# Altium project STM32G473CBT6_PMSMCtrl.PrjPcb
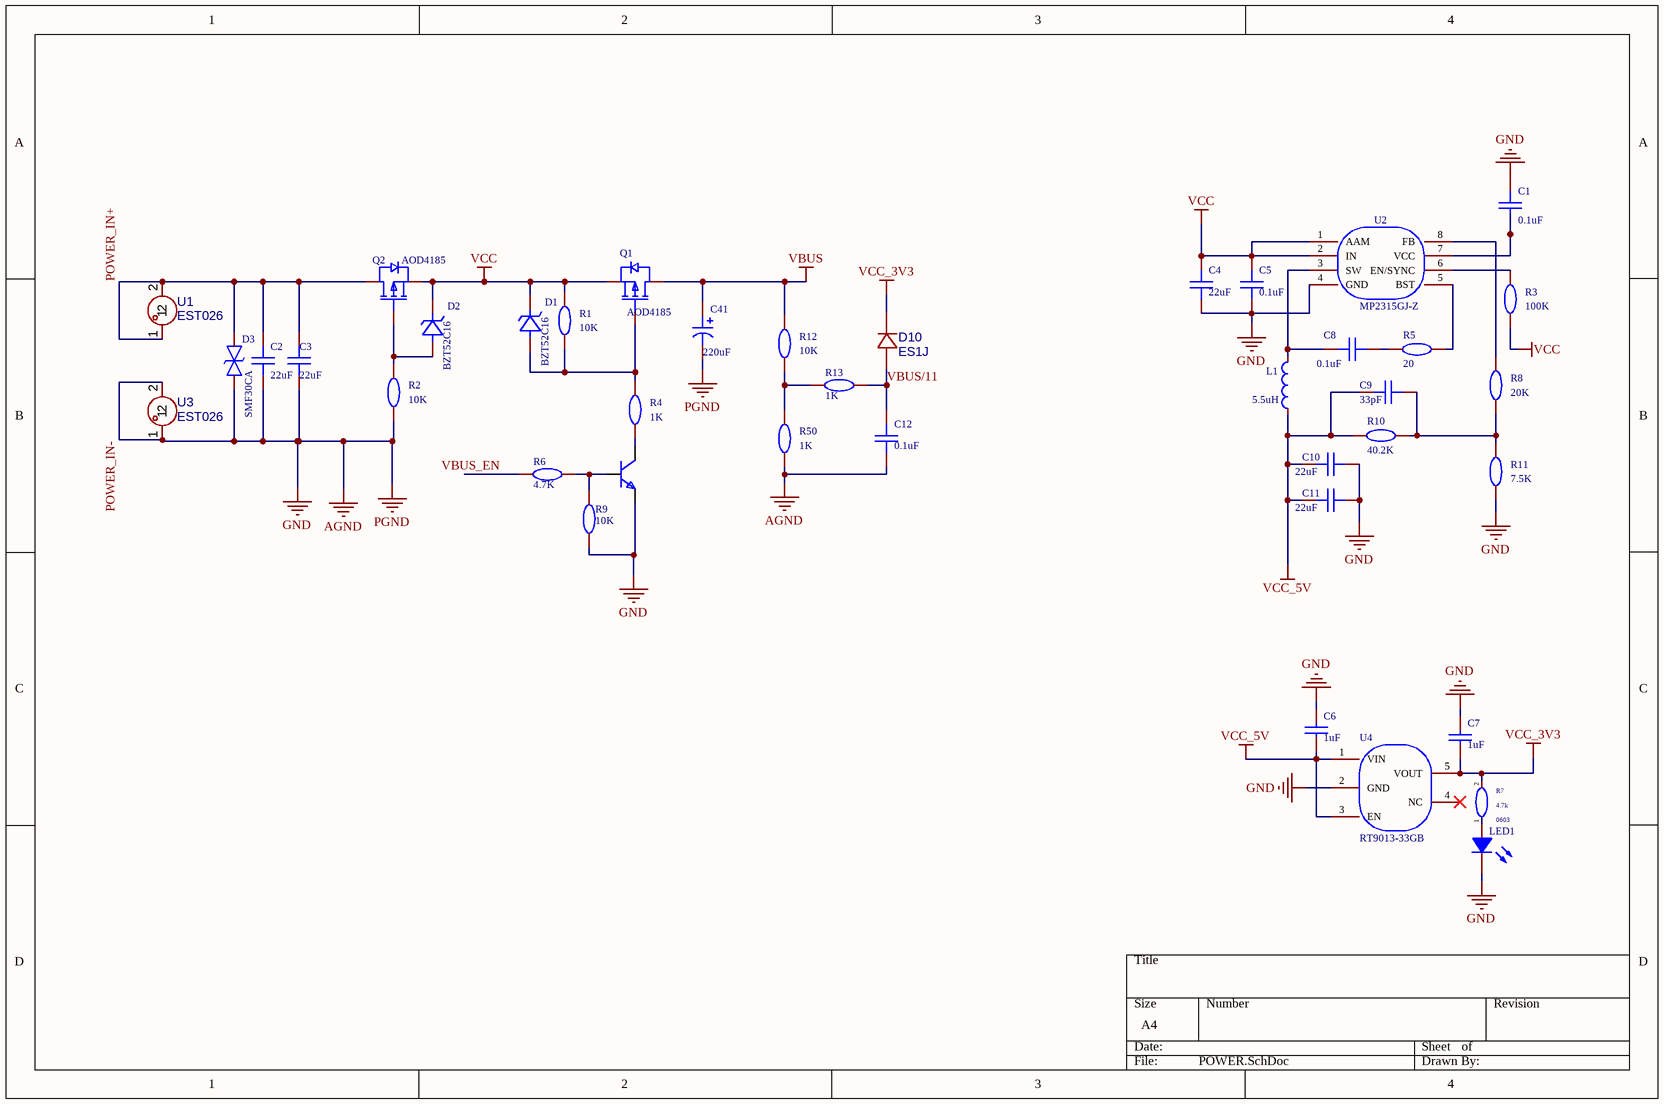
[diagram p0: POWER.SchDoc]
4 sheets, 168 parts. Net scope: global (net labels, ports and power ports of the same name join across sheets).
Board file: PCB1.PcbDoc
Sheets:
  POWER.SchDoc
  MCU.SchDoc
  PreDriver.SchDoc
  OPA.SchDoc

## Sheet POWER.SchDoc
size A4

### Parts
C1  0.1uF  [C0603]
C2  22uF  [C0603]
C3  22uF  [C0603]
C4  22uF  [C0603]
C5  0.1uF  [C0603]
C6  1uF  [C0603]
C7  1uF  [C0603]
C8  0.1uF  [C0603]
C9  33pF  [C0603]
C10  22uF  [C0805]
C11  22uF  [C0805]
C12  0.1uF  [C0603]
C41  220uF  [CAP-SMD_BD6.3-L6.6-W6.6-FD]
D1  BZT52C16  [SOD-123_L2.7-W1.6-LS3.7-RD]
D2  BZT52C16  [SOD-123_L2.7-W1.6-LS3.7-RD]
D3  SMF30CA  [SOD-123_L2.7-W1.8-LS3.7-BI]
D10  ES1J  [SMA_L4.4-W2.8-LS5.4-RD]
L1  5.5uH  [IND-SMD_L10.5-W10.2-HSB-1050]
LED1  (no value)  [LED_0603]
Q1  AOD4185  [TO-252-2_L6.6-W6.1-P4.57-LS9.9-BR-CW]
Q2  AOD4185  [TO-252-2_L6.6-W6.1-P4.57-LS9.9-BR-CW]
Q3  s8050_c20069125  [SOT-23-3_L2.9-W1.3-P1.90-LS2.3-BR]  (value not drawn)
R1  10K  [R0603]
R2  10K  [R0603]
R3  100K  [R0603]
R4  1K  [R0603]
R5  20  [R0603]
R6  4.7K  [R0603]
R7  value 4.7k  Footprint_1: 0603  [R0603]  (hidden comment: My_Library_Res-0603)
R8  20K  [R0603]
R9  10K  [R0603]
R10  40.2K  [R0603]
R11  7.5K  [R0603]
R12  10K  [R0603]
R13  1K  [R0603]
R50  1K  [R0603]
U1  EST026  [CONN-TH_L6.3-W0.8-EST026]
U2  MP2315GJ-Z  [TSOT-23-8_L2.9-W1.6-P0.65-LS2.8-BR]
U3  EST026  [CONN-TH_L6.3-W0.8-EST026]
U4  RT9013-33GB  [SOT-23-5_L3.0-W1.7-P0.95-LS2.8-BL]

### Nets
AGND: C1.1 C2.1 C3.1 C4.1 C5.1 C6.2 C7.2 C10.2 C11.2 C12.1 C41.2 D3.1 LED1.1(C) Q3.2(E) R2.1 R9.2 R11.1 R50.1 U2.4(GND) U3.1 U3.2 U4.2(GND)  [also labelled GND, PGND, POWER_IN-]
VBUS: C41.1 Q1.2(D) R12.2
VCC: C4.2 C5.2 D1.1(K) D2.1(K) Q1.3(S) Q2.3(S) R1.2 R3.2 U2.1(AAM) U2.2(IN)
VCC_3V3: C7.1 D10.1(C) R7.2 U4.5(VOUT)
VCC_5V: C6.1 C9.1 C10.1 C11.1 L1.1 R10.2 U4.1(VIN) U4.3(EN)
POWER_IN+: C2.2 C3.2 D3.2 Q2.2(D) U1.1 U1.2
VBUS/11: C12.2 D10.2(A) R13.1
VBUS_EN: R6.1
NetC1_2: C1.2 U2.7(VCC)
NetC8_1: C8.1 L1.2 U2.3(SW)
NetC8_2: C8.2 R5.1
NetC9_2: C9.2 R8.1 R10.1 R11.2
NetD1_2: D1.2(A) Q1.1(G) R1.1 R4.2
NetD2_2: D2.2(A) Q2.1(G) R2.2
NetLED1_2: LED1.2(A) R7.1
NetQ3_1: Q3.1(B) R6.2 R9.1
NetQ3_3: Q3.3(C) R4.1
NetR3_1: R3.1 U2.6(EN/SYNC)
NetR5_2: R5.2 U2.5(BST)
NetR8_2: R8.2 U2.8(FB)
NetR12_1: R12.1 R13.2 R50.2

Not connected (* = marked no-connect by the designer): U4 4(NC)*

### Library data of the parts
C1-C5 C8 C9 C12 = CAP_0603: Symbol: Capacitance; 3D Model: ac125912035d415993ca9572d50418b1聨0819f05c4eef4c71ace90d822a990e87; 3D Model Transform: 62.992,31.496,0,0,0,0,0,0,0; ConvertToPcb: yes; ModelName: C0603_L1.6-W0.8-H0.8; Device: CAP_0603; Supplier Footprint: 0603; AddInBom: yes; FootprintName: C0603
  C1 C5 C8 C12: Value: 0.1uF
  C2-C4: Value: 22uF
  C9: Value: 33pF
C6 C7 = CL10B105KA8NNNC: 容值:1uF;精度:±10%;额定电压:25V;温度系数:X7R;; Manufacturer: SAMSUNG(三星); 3D Model: ac125912035d415993ca9572d50418b1聨0819f05c4eef4c71ace90d822a990e87; 3D Model Transform: 62.992,31.496,0,0,0,0,0,0,0; Tolerance: ±10%; Voltage Rating: 25V; Temperature Coefficient: X7R; AddInBom: yes; ModelName: C0603_L1.6-W0.8-H0.8; Symbol: CL10B105KA8NNNC; Device: CL10B105KA8NNNC; LCSC Part Name: 1uF ±10% 25V; Supplier Part: C29936; Manufacturer Part: CL10B105KA8NNNC; Supplier Footprint: 0603; JLCPCB Part Class: Extended Part; Datasheet: https://item.szlcsc.com/datasheet/CL10B105KA8NNNC/30690.html; Supplier: LCSC; Value: 1uF; ConvertToPcb: yes; FootprintName: C0603
C10 C11 = CAP_0805: Symbol: Capacitance; 3D Model: 1ba041120af144c991958decab20d241聨0819f05c4eef4c71ace90d822a990e87; 3D Model Transform: 78.74,51.181,0,0,0,0,0,0.0005,0; ConvertToPcb: yes; ModelName: C0805_L2.0-W1.3-H1.3; Device: CAP_0805; Supplier Footprint: 0805; Value: 22uF; AddInBom: yes; FootprintName: C0805
C41 = JVJ35V220M6x8: 容值:220uF;精度:±20%;额定电压:35V;纹波电流:190mA@120Hz;; Manufacturer: JIERR(捷而瑞); AddInBom: yes; ModelId: ec7f1c7bda5e4386b54ec5ff3d1d94ff聨0819f05c4eef4c71ace90d822a990e87; ModelTransform: 307.086,259.842,0,180,0,0,0,0,0; Tolerance: ±20%; Voltage Rating: 35V; Lifetime: 2000hrs@105℃; Symbol: JVJ35V220M6X8; Device: JVJ35V220M6x8; LCSC Part Name: 220uF ±20% 35V; SupplierPart: C46550411; ManufacturerPart: JVJ35V220M6x8; Supplier Footprint: SMD,D6.3xL7.7mm; JLCPCB Part Class: Extended Part; Datasheet: https://item.szlcsc.com/datasheet/JVJ35V220M6x8/48680105.html; Supplier: LCSC; ConvertToPcb: yes; FootprintName: CAP-SMD_BD6.3-L6.6-W6.6-FD; ModelName: CAP-SMD_BD6.3-L6.6-W6.6-FD; Value: 220uF; Ripple Current: 190mA@120Hz; Diameter: 6.3mm; Height - Seated (Max): 7.7mm; Operating Temperature: -55℃~+105℃
D1 D2 = BZT52C16: 二极管配置:独立式;稳压值(标称值):16V;稳压值(范围):15.3V~17.1V;耗散功率(Pd):500mW;; Manufacturer: Slkor(萨科微); Symbol: BZT52C16_C707145; 3D Model: ad7e39f9e5534b3c96ffdc5532ebb493聨0819f05c4eef4c71ace90d822a990e87; 3D Model Transform: 146.026,62.992,0,180,0,0,0.0005,0,0; Diode Configuration: 独立式; Zener Voltage(Nom): 16V; Reverse Leakage Current (Ir): 100nA; Pd - Power Dissipation: 500mW; Impedance(Zzt): 40Ω; Operating Junction Temperature Range: -65℃~+150℃; AddInBom: yes; ModelName: SOD-123_L2.7-W1.6-H1.4-LS3.7; Device: BZT52C16; LCSC Part Name: 独立式 耐压:16V 电流:0.1uA; Supplier Part: C707145; Manufacturer Part: BZT52C16; Supplier Footprint: SOD-123; JLCPCB Part Class: Extended Part; Datasheet: https://item.szlcsc.com/datasheet/BZT52C16/744267.html; Supplier: LCSC; Zener Voltage(Range): 15.3V~17.1V; ConvertToPcb: yes; FootprintName: SOD-123_L2.7-W1.6-LS3.7-RD
D3 = SMF30CA: 反向截止电压(Vrwm):30V;最大钳位电压:48.4V;峰值脉冲电流(Ipp):4.2A;击穿电压:33.3V;; Manufacturer: AnBon(安邦); Symbol: SMF30CA_C435498; 3D Model: 8576f175c34f41329e79954aa68cc529聨0819f05c4eef4c71ace90d822a990e87; 3D Model Transform: 145.669,70.866,0,0,0,0,0,0,0; Reverse Stand-Off Voltage (Vrwm): 30V; Maximum Clamping Voltage: 48.4V; Peak Pulse Current (Ipp): 4.2A; Breakdown Voltage: 33.3V; Reverse Leakage Current (Ir): 5uA; Type: TVS; AddInBom: yes; Device: SMF30CA; LCSC Part Name: SMF30CA; Supplier Part: C435498; Manufacturer Part: SMF30CA; Supplier Footprint: SOD-123; JLCPCB Part Class: Extended Part; Datasheet: https://atta.szlcsc.com/upload/public/pdf/source/20191009/C435508_DB7B75E48DB0811659B52C5D7F67F4F0.pdf; Supplier: LCSC; ConvertToPcb: yes; FootprintName: SOD-123_L2.7-W1.8-LS3.7-BI; ModelName: SOD-123_L2.7-W1.8-LS3.7-BI
D10 = ES1J_C412438: 二极管配置:独立式;正向压降(Vf):1.7V@1A;直流反向耐压(Vr):600V;整流电流:1A;反向恢复时间(Trr):35ns;; Manufacturer: MDD(辰达半导体); Symbol: ES1JG_C412438; AddInBom: yes; ModelId: 4f1e9ef2303f48b48aa8ce0cacf8d7b1; ModelTransform: 204.724,102.362,0,0,0,0,0,0,0; Diode Configuration: 独立式; Voltage - DC Reverse(Vr): 600V; Current - Rectified: 1A; Reverse Leakage Current (Ir): 5uA@600V; Reverse Recovery Time (trr): 35ns; Operating Junction Temperature Range: -55℃~+150℃@(Tj); Device: ES1J_C412438; LCSC Part Name: 耐压:600V 电流:1A 反向恢复时间：35ns; SupplierPart: C412438; ManufacturerPart: ES1J; Supplier Footprint: SMA; JLCPCB Part Class: 扩展库; Datasheet: https://item.szlcsc.com/datasheet/ES1J/404261.html; Supplier: LCSC; ConvertToPcb: yes; FootprintName: SMA_L4.4-W2.8-LS5.4-RD; ModelName: SMA_L4.4-W2.8-LS5.4-RD; Voltage - Forward(Vf@If): 1.7V@1A
L1 = HSB-1050-5R5-M: 电感值:5.5uH;精度:±20%;额定电流:10A;饱和电流(Isat):12A;; Manufacturer: YOUCHI(佑驰); Tolerance: ±20%; Current Rating: 10A; Current - Saturation(Isat): 12A; DC Resistance(DCR): 10.3mΩ; AddInBom: yes; Symbol: HSB-1050-5R5-M; Device: HSB-1050-5R5-M; LCSC Part Name: 5.5uH  ±20%  12.0A; Supplier Part: C53373579; Manufacturer Part: HSB-1050-5R5-M; Supplier Footprint: SMD,10.5x10.2mm; JLCPCB Part Class: Extended Part; Datasheet: https://item.szlcsc.com/datasheet/HSB-1050-5R5-M/56489689.html; Supplier: LCSC; Value: 5.5uH; ConvertToPcb: yes; FootprintName: IND-SMD_L10.5-W10.2-HSB-1050
LED1 = LED_0603-B: Symbol: LED_B; Convert to PCB: yes; 3D Model: eb8d964598f24248affda46f619856c5聨0819f05c4eef4c71ace90d822a990e87; 3D Model Transform: 63.1,31.6,23.7,0,0,0,0,0,0; ModelName: LED-0603_B; Device: LED_0603-B; Add into BOM: yes; Supplier Footprint: 0603; FootprintName: LED_0603
Q1 Q2 = AOD4185_C2984007: Manufacturer: ISC(无锡固电); 3D Model: ce57f84d66384067af8a68020b6de06d聨0819f05c4eef4c71ace90d822a990e87; 3D Model Transform: 259.842,390.52442,0,90,0,0,-39.39,0,0; AddInBom: yes; ModelName: TO-252-2L-3P_L6.6-W6.1-H2.3-LS10.1-P4.6; Symbol: AOD4185_C2984007; Device: AOD4185_C2984007; LCSC Part Name: AOD4185; Supplier Part: C2984007; Manufacturer Part: AOD4185; Supplier Footprint: TO-252; JLCPCB Part Class: Extended Part; Supplier: LCSC; ConvertToPcb: yes; FootprintName: TO-252-2_L6.6-W6.1-P4.57-LS9.9-BR-CW
Q3 = s8050_c20069125: 晶体管类型:NPN;集电极电流(Ic):500mA;集射极击穿电压(Vceo):25V;耗散功率(Pd):300mW;直流电流增益(hFE):120;; Manufacturer: R+O(宏嘉诚); ManufacturerPart: S8050; AddInBom: yes; ModelId: 5504beb8757f4de79731898ec55d3e54; ModelTransform: 114.173,90.551,0,90,0,0,0,0,0; type: NPN; Current - Collector(Ic): 500mA; Collector - Emitter Voltage VCEO: 25V; Pd - Power Dissipation: 300mW; DC Current Gain: 120; Transition frequency(fT): 100MHz; Current - Collector Cutoff: 100nA; Vce Saturation(VCE(sat)): 600mV; Emitter-Base Voltage(Vebo): 5V; Number: 1个NPN; Configuration: 独立式; Symbol: S8050_C20069125; LCSC Part Name: hFE:200-350，丝印:J3Y NPN 500mA 25V; SupplierPart: C20069125; Supplier Footprint: SOT-23; JLCPCB Part Class: Extended Part; Datasheet: https://item.szlcsc.com/datasheet/S8050/21397163.html; Supplier: LCSC; ConvertToPcb: yes; FootprintName: SOT-23-3_L2.9-W1.3-P1.90-LS2.3-BR; ModelName: SOT-23-3_L2.9-W1.3-P1.90-LS2.3-BR; Operating Temperature: -55℃~+150℃
R1-R3 R5 R8-R12 = Res_0603: Symbol: 电阻; 3D Model: fc143cca1e79419f9cd78b61e9279f08聨0819f05c4eef4c71ace90d822a990e87; 3D Model Transform: 31.8897,63.7794,0,90,0,0,0,0,0; ConvertToPcb: yes; Device: Res_0603; Supplier Footprint: 0603; AddInBom: yes; FootprintName: R0603; ModelName: R0603
  R1 R2 R9 R12: Value: 10K
  R3: Value: 100K
  R5: Value: 20
  R8: Value: 20K
  R10: Value: 40.2K
  R11: Value: 7.5K
R4 R6 R13 R50 = Res_0603: Symbol: 电阻; 3D Model: fc143cca1e79419f9cd78b61e9279f08聨0819f05c4eef4c71ace90d822a990e87; 3D Model Transform: 31.8897,63.7794,0,90,0,0,0,0,0; Value: 10K; ConvertToPcb: yes; Device: Res_0603; Supplier Footprint: 0603; AddInBom: yes; FootprintName: R0603; ModelName: R0603
R7 = My_Library_Res-0603: Origin Footprint: MyPCBLibrary:R0603; AddInBom: yes; Symbol: My_Library_Res-0603; Device: My_Library_Res-0603
U1 U3 = EST026: 环保; Manufacturer: xcfuse(旭程); AddInBom: yes; ModelId: caeb915258b34f389ee2048176497ca2; ModelTransform: 328.7395,78.74,0,0,0,0,0,0,-137.795; Symbol: EST026; Device: EST026; LCSC Part Name: EST026; SupplierPart: C52878; ManufacturerPart: EST026; Supplier Footprint: 插件; JLCPCB Part Class: 扩展库; Datasheet: https://item.szlcsc.com/datasheet/EST026/53893.html; Supplier: LCSC; ConvertToPcb: yes; FootprintName: CONN-TH_L6.3-W0.8-EST026; ModelName: CONN-TH_L6.3-W0.8-EST026
U2 = MP2315GJ-Z: 功能类型:降压型;工作电压:4.5V~24V;输出电压:800mV~22.8V;输出电流:3A;输出类型:可调;; Manufacturer: MPS(芯源); 3D Model: a4a866e84c1d4e21a00dbb6d6e7ebbb6聨0819f05c4eef4c71ace90d822a990e87; 3D Model Transform: 110.45568,114.173,0,180,0,0,0,0,0; Function: 降压型; Output Current: 3A; Frequency - Switching: 500kHz; Synchronous Rectifier: 是; Number of Outputs: 1; Topology: 降压式; Quiescent Current: 180uA; Switch tube (built-in/external): 内置; Output Type: 可调; AddInBom: yes; Symbol: MP2315GJ-Z; Device: MP2315GJ-Z; LCSC Part Name: 降压型 3A 4.5V~24V; Supplier Part: C45889; Manufacturer Part: MP2315GJ-Z; Supplier Footprint: TSOT-23-8; JLCPCB Part Class: Extended Part; Datasheet: https://item.szlcsc.com/datasheet/MP2315GJ-Z/46892.html; Supplier: LCSC; Voltage - Supply: 4.5V~24V; Output Voltage: 800mV~22.8V; Operating Temperature: -40℃~+125℃; Features: 轻载高效模式；内置LDO稳压器；频率同步；逐波限流；过流保护；打嗝限流; ConvertToPcb: yes; FootprintName: TSOT-23-8_L2.9-W1.6-P0.65-LS2.8-BR; ModelName: TSOT-23-8_L2.9-W1.6-P0.65-LS2.8-BR
U4 = RT9013-33GB: 输出极性:正极;工作电压:5.5V;输出电压:3.3V;输出电流:500mA;电源纹波抑制比(PSRR):50dB@(10kHz);输出类型:固定;; Manufacturer: RICHTEK(立锜); 3D Model: 0a2a1b8f50944f73965918ad6e5fe167聨0819f05c4eef4c71ace90d822a990e87; 3D Model Transform: 118.60433,114.173,0,90,0,0,0.0005,0.0005,0; Output Configuration: 正极; Voltage - Supply: 5.5V; Output Voltage: 3.3V; Output Current: 500mA; Voltage Dropout: 400mV@(500mA); standby current: 25uA; Noise: 30uVrms; Output Type: 固定; Number of Outputs: 1; AddInBom: yes; ModelName: SOT-23-5_L2.9-W1.6-H1.1-LS2.8-P0.95; Symbol: RT9013-33GB; Device: RT9013-33GB; LCSC Part Name: 3.3V 500mA 5.5V; Supplier Part: C47773; Manufacturer Part: RT9013-33GB; Supplier Footprint: SOT-23-5; JLCPCB Part Class: Extended Part; Datasheet: https://item.szlcsc.com/datasheet/RT9013-33GB/48778.html; Supplier: LCSC; Power Supply Rejection Ratio (PSRR): 50dB@(10kHz); Features: 使能控制；短路保护；过流保护；热关断; Operating Temperature: -40℃~+125℃@(Tj); ConvertToPcb: yes; FootprintName: SOT-23-5_L3.0-W1.7-P0.95-LS2.8-BL

## Sheet MCU.SchDoc
size A4
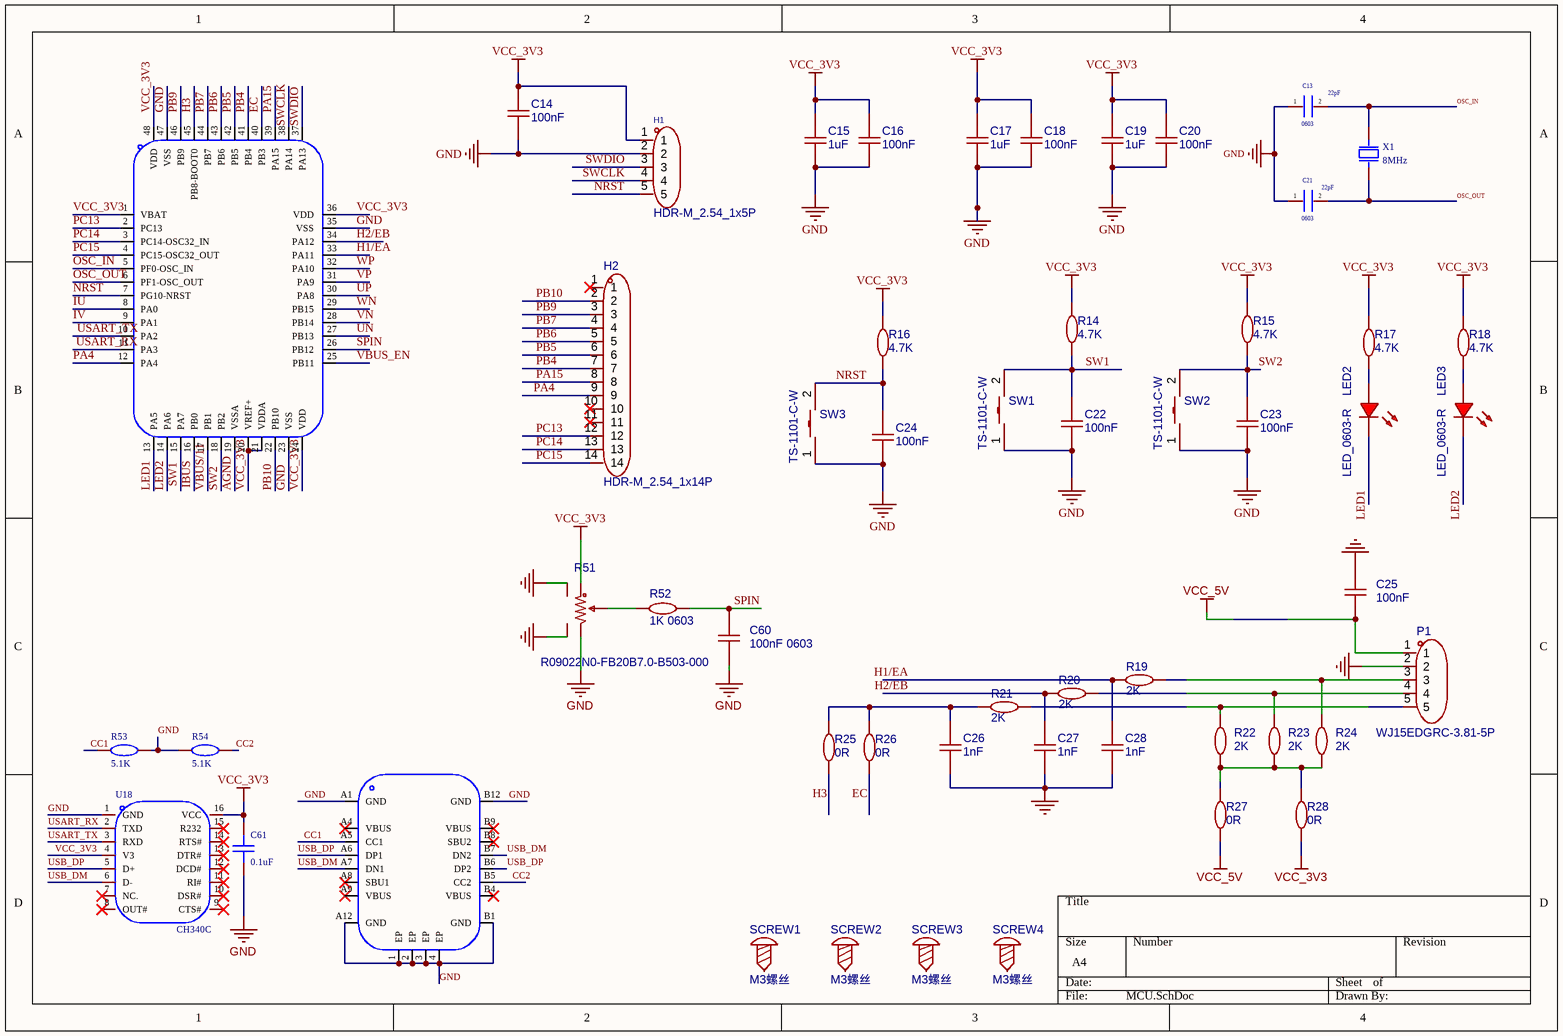
[diagram p1: MCU.SchDoc]

### Parts
C13  value 22pF  Footprint_1: 0603  [C0603]  (hidden comment: My_Library_Cap-0603)
C14  100nF  [C0603]
C15  1uF  [C0603]
C16  100nF  [C0603]
C17  1uF  [C0603]
C18  100nF  [C0603]
C19  1uF  [C0603]
C20  100nF  [C0603]
C21  value 22pF  Footprint_1: 0603  [C0603]  (hidden comment: My_Library_Cap-0603)
C22  100nF  [C0603]
C23  100nF  [C0603]
C24  100nF  [C0603]
C25  100nF  [C0603]
C26  1nF  [C0603]
C27  1nF  [C0603]
C28  1nF  [C0603]
C60  100nF 0603  [C0603]
C61  0.1uF  [C0603]
H1  HDR-M_2.54_1x5P  [HDR-TH_5P-P2.54-V-M]
H2  HDR-M_2.54_1x14P  [HDR-TH_14P-P2.54-V-M]
LED2  LED_0603-R  [LED_0603]
LED3  LED_0603-R  [LED_0603]
P1  WJ15EDGRC-3.81-5P  [CONN-TH_5P-P3.81_WJ15EDGRC-3.81-5P]
R14  4.7K  [R0603]
R15  4.7K  [R0603]
R16  4.7K  [R0603]
R17  4.7K  [R0603]
R18  4.7K  [R0603]
R19  2K  [R0603]
R20  2K  [R0603]
R21  2K  [R0603]
R22  2K  [R0603]
R23  2K  [R0603]
R24  2K  [R0603]
R25  0R  [R0603]
R26  0R  [R0603]
R27  0R  [R0603]
R28  0R  [R0603]
R51  R09022N0-FB20B7.0-B503-000  [RES-ADJ-TH_R09022N0-FB20B7B503-0004]
R52  1K 0603  [R0603]
R53  5.1K  [R0603]
R54  5.1K  [R0603]
SCREW1  M3螺丝  [PCBComponent_1 - duplicate]
SCREW2  M3螺丝  [PCBComponent_1 - duplicate]
SCREW3  M3螺丝  [PCBComponent_1 - duplicate]
SCREW4  M3螺丝  [PCBComponent_1 - duplicate]
SW1  TS-1101-C-W  [SW-SMD_L6.0-W3.3-LS8.0]
SW2  TS-1101-C-W  [SW-SMD_L6.0-W3.3-LS8.0]
SW3  TS-1101-C-W  [SW-SMD_L6.0-W3.3-LS8.0]
U5  stm32g473cbt6  [LQFP-48_L7.0-W7.0-P0.50-LS9.0-BL]  (value not drawn)
U18  CH340C  [SOP-16_L10.0-W3.9-P1.27-LS6.0-BL]
USB1  kh-type-c-16p  [USB-C-SMD_KH-TYPE-C-16P]  (value not drawn)
X1  8MHz  [CRYSTAL-SMD_L11.5-W4.8-LS12.7]

### Nets
AGND: C13.1 C14.1 C15.1 C16.1 C17.1 C18.1 C19.1 C20.1 C21.1 C22.1 C23.1 C24.1 C25.2 C26.1 C27.1 C28.1 C60.2 C61.2 H1.2 P1.2 R51.3 R51.4 R51.5 R53.2 R54.1 SW1.1 SW2.1 SW3.1 U5.19(VSSA) U5.23(VSS) U5.35(VSS) U5.47(VSS) U18.1(GND) USB1.1(EP) USB1.2(EP) USB1.3(EP) USB1.4(EP) USB1.A1(GND) USB1.A12(GND) USB1.B1(GND) USB1.B12(GND)  [also labelled GND]
VCC_3V3: C14.2 C15.2 C16.2 C17.2 C18.2 C19.2 C20.2 C61.1 H1.1 R14.2 R15.2 R16.2 R17.2 R18.2 R28.1 R51.1 U5.1(VBAT) U5.20(VREF+) U5.21(VDDA) U5.24(VDD) U5.36(VDD) U5.48(VDD) U18.4(V3) U18.16(VCC)
VCC_5V: C25.1 P1.1 R27.2
CC1: R53.1 USB1.A5(CC1)
CC2: R54.2 USB1.B5(CC2)
EC: R26.1 U5.40(PB3)
H1/EA: C28.2 R19.1 U5.33(PA11)
H2/EB: C27.2 R20.1 U5.34(PA12)
H3: R25.2 U5.45(PB8-BOOT0)
IBUS: U5.16(PB0)
IU: U5.8(PA0)
IV: U5.9(PA1)
LED1: LED2.1(C) U5.13(PA5)
LED2: LED3.1(C) U5.14(PA6)
NRST: C24.2 H1.5 R16.1 SW3.2 U5.7(PG10-NRST)
OSC_IN: C13.2 U5.5(PF0-OSC_IN) X1.1(OSC1)
OSC_OUT: C21.2 U5.6(PF1-OSC_OUT) X1.2(OSC2)
PA4: H2.9 U5.12(PA4)
PA15: H2.8 U5.39(PA15)
PB4: H2.7 U5.41(PB4)
PB5: H2.6 U5.42(PB5)
PB6: H2.5 U5.43(PB6)
PB7: H2.4 U5.44(PB7)
PB9: H2.3 U5.46(PB9)
PB10: H2.2 U5.22(PB10)
PC13: H2.12 U5.2(PC13)
PC14: H2.13 U5.3(PC14-OSC32_IN)
PC15: H2.14 U5.4(PC15-OSC32_OUT)
SPIN: C60.1 R52.1 U5.26(PB12)
SW1: C22.2 R14.1 SW1.2 U5.15(PA7)
SW2: C23.2 R15.1 SW2.2 U5.18(PB2)
SWCLK: H1.4 U5.38(PA14)
SWDIO: H1.3 U5.37(PA13)
UN: U5.27(PB13)
UP: U5.30(PA8)
USART_RX: U5.11(PA3) U18.2(TXD)
USART_TX: U5.10(PA2) U18.3(RXD)
USB_DM: U18.6(D-) USB1.A7(DN1) USB1.B7(DN2)
USB_DP: U18.5(D+) USB1.A6(DP1) USB1.B6(DP2)
VBUS/11: U5.17(PB1)
VBUS_EN: U5.25(PB11)
VN: U5.28(PB14)
VP: U5.31(PA9)
WN: U5.29(PB15)
WP: U5.32(PA10)
NetC26_2: C26.2 R21.1 R25.1 R26.2
NetLED2_2: LED2.2(A) R17.1
NetLED3_2: LED3.2(A) R18.1
NetP1_3: P1.3 R19.2 R24.1
NetP1_4: P1.4 R20.2 R23.1
NetP1_5: P1.5 R21.2 R22.1
NetR22_2: R22.2 R23.2 R24.2 R27.1 R28.2
NetR51_2: R51.2 R52.2

Not connected (* = marked no-connect by the designer): H2 1* 10* 11*; SCREW1 1; SCREW2 1; SCREW3 1; SCREW4 1; U18 7(NC.)* 8(OUT#)* 9(CTS#)* 10(DSR#)* 11(RI#)* 12(DCD#)* 13(DTR#)* 14(RTS#)* 15(R232)*; USB1 A4(VBUS)* A8(SBU1)* A9(VBUS)* B4(VBUS)* B8(SBU2)* B9(VBUS)*

### Library data of the parts
C13 C21 = My_Library_Cap-0603: Origin Footprint: MyPCBLibrary:C0603; AddInBom: yes; Symbol: My_Library_Cap-0603; Device: My_Library_Cap-0603
C14 C16 C18 C20 C22-C25 C60 = CAP_0603: ConvertToPcb: yes; SymbolName: CapAcitance; ModelId: ac125912035d415993ca9572d50418b1; ModelName: C0603_L1.6-W0.8-H0.8; ModelTransform: 62.992,31.496,0,0,0,0,0,0,0; Device: CAP_0603; AddInBom: yes; Supplier Footprint: 0603; FootprintName: C0603
  C14 C16 C18 C20 C22-C25: Value: 100nF
  C60: Value: 100nF 0603
C15 C17 C19 = CAP_0603_2: ConvertToPcb: yes; SymbolName: CapAcitance; ModelId: ac125912035d415993ca9572d50418b1; ModelName: C0603_L1.6-W0.8-H0.8; ModelTransform: 62.992,31.496,0,0,0,0,0,0,0; Value: 1uF; Device: CAP_0603; AddInBom: yes; Supplier Footprint: 0603; FootprintName: C0603
C26-C28 = CAP_0603_3: ConvertToPcb: yes; SymbolName: CapAcitance; ModelId: ac125912035d415993ca9572d50418b1; ModelName: C0603_L1.6-W0.8-H0.8; ModelTransform: 62.992,31.496,0,0,0,0,0,0,0; Value: 1nF; Device: CAP_0603; AddInBom: yes; Supplier Footprint: 0603; FootprintName: C0603
C61 = CAP_0805: as C10 on sheet POWER; Device: CAP_0805; Supplier Footprint: 0805; Value: 0.1uF; AddInBom: yes; FootprintName: C0603
H1 = HDR-M_2.54_1x5P: Manufacturer: MINTRON(明硕); Symbol: MTP125-1105S1; ConvertToPcb: yes; ModelId: 47d466e4a34f4fc5bc626cf773a24dd5; ModelName: HDR-TH_5P-P2.54-M-LI-1X5P; ModelTransform: 499.999,100,0,0,0,0,0,0,-118.11; Device: HDR-M_2.54_1x5P; Supplier: LCSC; Supplier Part: C358687; Manufacturer Part: MTP125-1105S1; JLCPCB Part Class: Extended Part; AddInBom: yes; Supplier Footprint: 插件; FootprintName: HDR-TH_5P-P2.54-V-M
H2 = HDR-M_2.54_1x14P: 间距:2.54mm;总PIN位数:14;排数:1;插针结构:1x14P;行距:-;安装类型:直插;圆针/方针:方针;额定电流:3A;额定电压:-;配合针长度:6mm;塑高:2.5mm;端接针长度:3mm;触头材质:-;工作温度范围:-40℃~+105℃;颜色:黑色;; Symbol: HDR_2.54-1x14P; ConvertToPcb: yes; ModelId: d38966ad4fa34699b6d9af72e76b3bd5; ModelName: HDR-TH_14P-P2.54-M-LI-1X14P; ModelTransform: 1390.155,92.913,0,0,0,0,0,0,-137.795; Device: HDR-M_2.54_1x14P; AddInBom: yes; SupplierPart: C2894937; Supplier Footprint: 插件; FootprintName: HDR-TH_14P-P2.54-V-M
LED2 LED3 = LED_0603-R: Symbol: LED_R; Convert to PCB: yes; 3D Model: dd8257b0d61a4cd7b68939a056e08095; 3D Model Transform: 58.72,29.4,22.03,0,0,0,0,0,0; ModelName: LED-0603_R; Device: LED_0603-R; Add into BOM: yes; Supplier Footprint: 0603; FootprintName: LED_0603
P1 = WJ15EDGRC-3.81-5P: 连接器类型:板端/插座-闭口;固定方式:-;结构:1x5P;间距:3.81mm;颜色:-;安装方式:弯针;排数:1;每排PIN数:5;额定电流:-;额定电压:-;线规 - AWG:-;线规 - 平方毫米:-;工作温度:-40℃~+105℃;; Manufacturer: KANGNEX(康奈克斯电气); AddInBom: yes; ModelId: 1f5bfc586d7a497a94e16b2138b9ad12; ModelName: CONN-TH_WJ3.81-WI-5P; ModelTransform: 784.64406,360.2355,0,0,0,0,-0.197,-118.11,-137.795; Number of Positions or Pins: 1x5P; Pitch: 3.81mm; Number of PINs Per Row: 5; Symbol: WJ15EDGRC-3.81-5P; Device: WJ15EDGRC-3.81-5P; LCSC Part Name: 1x5P 3.81mm 排数:1 每排P数:5; SupplierPart: C8395; ManufacturerPart: WJ15EDGRC-3.81-5P; Supplier Footprint: 弯插,P=3.81mm; JLCPCB Part Class: 扩展库; Datasheet: https://item.szlcsc.com/datasheet/WJ15EDGRC-3.81-5P/8889.html; Supplier: LCSC; ConvertToPcb: yes; FootprintName: CONN-TH_5P-P3.81_WJ15EDGRC-3.81-5P; Connector Type: 板端/插座-闭口; Termination Style: -; Color: -; Mounting Type: 弯针; Number of Pins: 5P; Number of Rows: 1; Current Rating: -; Voltage Rating (Max): -; Wire Gauge - AWG: -; Wire Gauge - mm2: -; Operating Temperature: -40℃~+105℃; Connection Type: -; Outlet Direction (Vertical Basis): -
R14-R18 = Res_0603_1: Symbol: 电阻; ConvertToPcb: yes; ModelId: fc143cca1e79419f9cd78b61e9279f08; ModelTransform: 31.8897,63.7794,0,90,0,0,0,0,0; Value: 4.7K; Device: Res_0603; AddInBom: yes; Supplier Footprint: 0603; FootprintName: R0603; ModelName: R0603
R19-R24 R52 = Res_0603: Symbol: 电阻; ConvertToPcb: yes; ModelId: fc143cca1e79419f9cd78b61e9279f08; ModelTransform: 31.8897,63.7794,0,90,0,0,0,0,0; Device: Res_0603; AddInBom: yes; Supplier Footprint: 0603; FootprintName: R0603; ModelName: R0603
  R19-R24: Value: 2K
  R52: Value: 1K 0603
R25-R28 = Res_0603: Value: 2K; Symbol: 电阻; ConvertToPcb: yes; ModelId: fc143cca1e79419f9cd78b61e9279f08; ModelTransform: 31.8897,63.7794,0,90,0,0,0,0,0; Device: Res_0603; AddInBom: yes; Supplier Footprint: 0603; FootprintName: R0603; ModelName: R0603
R51 = R09022N0-FB20B7.0-B503-000: 可调电阻旋转电位器; Manufacturer: CTR(长泰尔电子); AddInBom: yes; ModelId: 71d2ca23f0844f7d968f95a814dfb0e2; ModelTransform: 450.24737,500.038,0,0,0,0,0,104.055,-149.606; Voltage Rating: 10V; Symbol: R09022N0-FB20B7.0-B503-000; Device: R09022N0-FB20B7.0-B503-000; LCSC Part Name: R09022N0-FB20B7.0-B503-000; SupplierPart: C18213417; ManufacturerPart: R09022N0-FB20B7.0-B503-000; Supplier Footprint: 插件; JLCPCB Part Class: 扩展库; Datasheet: https://atta.szlcsc.com/upload/public/pdf/source/20231010/93ED3CE9FDD6AC93F067D89ACCCFD006.pdf; Supplier: LCSC; ConvertToPcb: yes; FootprintName: RES-ADJ-TH_R09022N0-FB20B7B503-0004; ModelName: RES-ADJ-TH_R09022N0-FB20B7B503-0004
R53 R54 = Res_0603: as R1 on sheet POWER; Device: Res_0603; Supplier Footprint: 0603; Value: 5.1K; AddInBom: yes; FootprintName: R0603; ModelName: R0603
SCREW1-SCREW4 = M3螺丝: ConvertToPcb: yes; SymbolName: 螺丝孔; Device: M3螺丝; AddInBom: yes; Supplier Footprint: 插件; FootprintName: M3螺丝
SW1-SW3 = TS-1101-C-W: 电路结构:单刀单掷;按钮形状:矩形按钮;作用力:260gf;安装方式:立贴;开关长度:6mm;开关宽度:3.6mm;开关高度:2.5mm;带支架:不带;触点电流:50mA;额定电压(AC):-;额定电压(DC):12V;额定功率:-;绝缘电阻:-;带灯:无;机械寿命:5万次;; Manufacturer: XKB Connectivity(中国星坤); AddInBom: yes; ModelId: b2f4ea9f0afc4b0786d53dba66ceb9e4; ModelName: SW-SMD_L6.0-W3.3-H5-LS8.0; ModelTransform: 314.96,129.921,0,0,0,0,0,0,0; Circuit: 单刀单掷; Actuator Style: 矩形按钮; Operating Force: 260gf; Switch Length: 6mm; Switch Width: 3.6mm; Switch Height: 2.5mm; Strike Gundam: 不带; Contact Current: 50mA; Voltage Rating (DC): 12V; Actuator/Cap Color: 白色带淡绿; With Lamp: 无; Mechanical Life: 5万次; Symbol: TS-1101-C-W; Device: TS-1101-C-W; LCSC Part Name: 6*3.6*2.5mm 立贴 轻触开关; SupplierPart: C318938; ManufacturerPart: TS-1101-C-W; Supplier Footprint: SMD; JLCPCB Part Class: 扩展库; Datasheet: https://atta.szlcsc.com/upload/public/pdf/source/20200227/C318938_C2E53B1EEDE37D980A33616AC086DE53.pdf; Supplier: LCSC; ConvertToPcb: yes; FootprintName: SW-SMD_L6.0-W3.3-LS8.0; Mounting Style: 立贴; Voltage Rating (AC): -; Power Rating: -; Insulation Resistance: -; IP Rating: -; Pin Style: -; Operating Temperature: -30℃~+85℃
U5 = stm32g473cbt6: CPU内核:ARM Cortex-M4;CPU最大主频:170MHz;CPU位数:32 Bit;; Manufacturer: ST(意法半导体); AddInBom: yes; ModelId: 093be70396ff421eb2cdb946d5311efc; ModelName: LQFP-48_L7.0-W7.0-H1.4-LS9.0-P0.50; ModelTransform: 354.331,354.331,0,0,0,0,0,0,0; CPU Maximum Speed: 170MHz; Core Size: 32 Bit; Program Storage Size: 128KB; Program Memory Type: FLASH; Number of I/O: 38; Oscillator Type: 内置+外置; Voltage - Supply: 1.71V~3.6V; Symbol: STM32G473CBT6; LCSC Part Name: 带DSP和FPU的170MHz主流ARM Cortex-M4 MCU，具有128 KB Flash存储器、数学加速器和高模拟电平集成; SupplierPart: C730111; ManufacturerPart: STM32G473CBT6; Supplier Footprint: LQFP-48(7x7); JLCPCB Part Class: Extended Part; Datasheet: https://item.szlcsc.com/datasheet/STM32G473CBT6/778066.html; Supplier: LCSC; ConvertToPcb: yes; FootprintName: LQFP-48_L7.0-W7.0-P0.50-LS9.0-BL; CPU Core: ARM Cortex-M4; RAM Size: 128KB; EEPROM: -; Operating Temperature: -40℃~+85℃
U18 = CH340C: 应用功能:收发器;USB协议版本:USB 2.0;通道数:-;数据速率:2Mbps;; Manufacturer: WCH(南京沁恒); 3D Model: 3361a6792abf4a8f8fbca4f1924a67ee聨0819f05c4eef4c71ace90d822a990e87; 3D Model Transform: 240.39054,393.7,0,90,0,0,0,0,0; Applications Function: 收发器; USB Protocol: USB 2.0; Voltage - Supply: 3.3V；5V; Data Rate: 2Mbps; Current - Supply: 7mA; Quiescent Supply Current: 50uA; AddInBom: yes; ModelName: SOP-16_L9.9-W3.9-H1.5-LS6.0-P1.27; Symbol: CH340C; Device: CH340C; LCSC Part Name: USB转串口芯片; Supplier Part: C84681; Manufacturer Part: CH340C; Supplier Footprint: SOP-16; JLCPCB Part Class: Extended Part; Datasheet: https://item.szlcsc.com/datasheet/CH340C/85852.html; Supplier: LCSC; Number of Channels: -; Operating Temperature: -20℃~+70℃; Features: 可编程波特率；内置时钟发生器；上电复位; ConvertToPcb: yes; FootprintName: SOP-16_L10.0-W3.9-P1.27-LS6.0-BL
USB1 = kh-type-c-16p: 连接器类型:Type-C;协议标准:-;公母:母;安装方式:卧贴;触点数量:16P;端口数量:1;额定电流 - 电源:3A;工作温度:-40℃~+85℃;; Manufacturer: kinghelm(金航标); AddInBom: yes; ModelId: f2c381012fbf47e0b76dea5162270f01; ModelTransform: 351.9678,307.48,0,0,0,0,0,-45.276,-43.307; Connector Type: Type-C; Gender: 母; Number of Contacts: 16P; Number of Ports: 1; Current Rating-Power: 3A; Voltage Rating: 30V; Connect-Disconnect Life: 1万次; Symbol: KH-TYPE-C-16P; LCSC Part Name: Type-C 母 卧贴; SupplierPart: C709357; ManufacturerPart: KH-TYPE-C-16P; Supplier Footprint: SMD; JLCPCB Part Class: Extended Part; Datasheet: https://item.szlcsc.com/datasheet/KH-TYPE-C-16P/747093.html; Supplier: LCSC; ConvertToPcb: yes; FootprintName: USB-C-SMD_KH-TYPE-C-16P; ModelName: USB-C-SMD_KH-TYPE-C-16P; Protocol Standard: -; Mounting Type: 卧贴; Length: 7.81mm; Operating Temperature: -40℃~+85℃
X1 = X49SM8MSD2SC: 晶振类型:贴片晶振;频率:8MHz;常温频差:±20ppm;负载电容:20pF;频率稳定度:±30ppm;; Manufacturer: YXC(扬兴晶振); 3D Model: 6f569b91267b44029b8615eb5c810fba聨0819f05c4eef4c71ace90d822a990e87; 3D Model Transform: 499.999,188.976,0,180,0,0,0.002,-0.002,0; Normal temperature Frequency Tolerance: ±20ppm; Load Capacitance: 20pF; Frequency Stability: ±30ppm; AddInBom: yes; ModelName: HC-49S_L11.4-W1.8-H3.0-LS12.7; Symbol: X49SM8MSD2SC; Device: X49SM8MSD2SC; LCSC Part Name: HC-49SMD 8MHZ 20PF ±20PPM -20~70℃（±30PPM）; Supplier Part: C12674; Manufacturer Part: X49SM8MSD2SC; Supplier Footprint: HC-49S-SMD; JLCPCB Part Class: Basic Part; Datasheet: https://item.szlcsc.com/datasheet/X49SM8MSD2SC/13310.html; Supplier: LCSC; Type: 贴片晶振; Value: 8MHz; Operating Temperature: -20℃~+70℃; ConvertToPcb: yes; FootprintName: CRYSTAL-SMD_L11.5-W4.8-LS12.7

## Sheet PreDriver.SchDoc
size A4
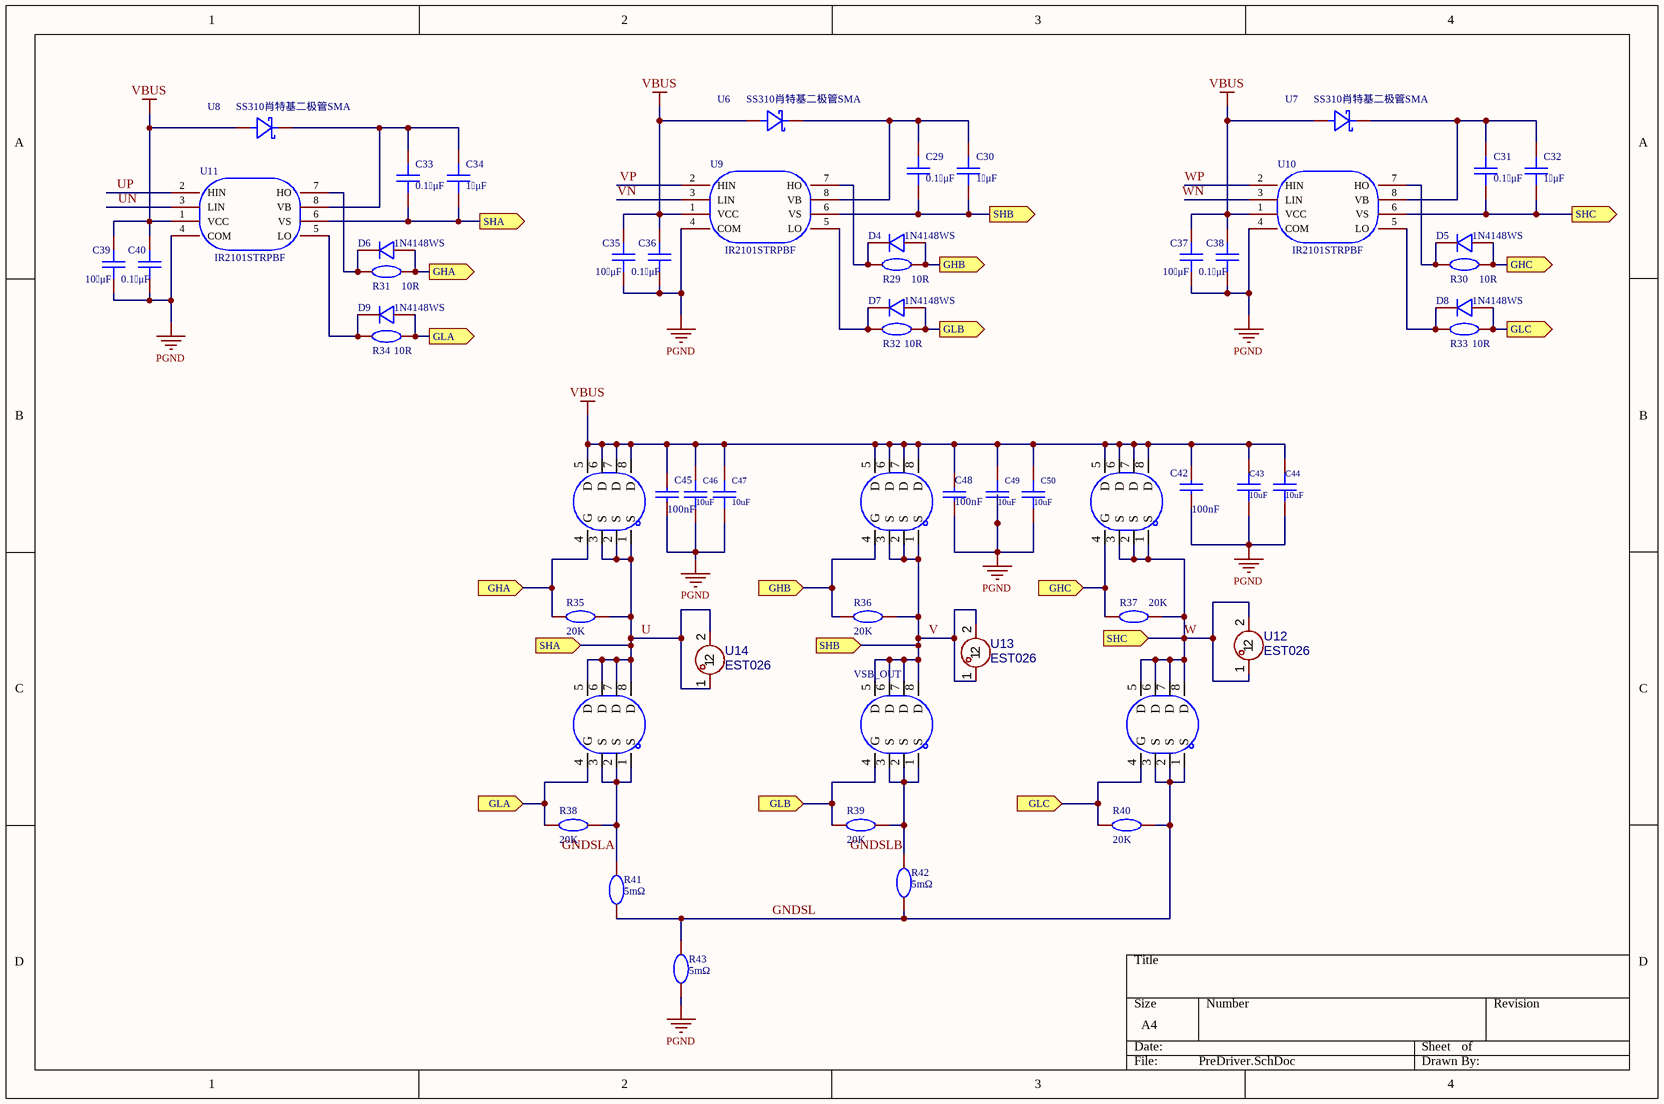
[diagram p2: PreDriver.SchDoc]

### Parts
C29  0.1 μF  [C0603]
C30  1 μF  [C0603]
C31  0.1 μF  [C0603]
C32  1 μF  [C0603]
C33  0.1 μF  [C0603]
C34  1 μF  [C0603]
C35  10 μF  [C0603]
C36  0.1 μF  [C0603]
C37  10 μF  [C0603]
C38  0.1 μF  [C0603]
C39  10 μF  [C0603]
C40  0.1 μF  [C0603]
C42  100nF  [C1206]
C43  10uF  [C1206]
C44  10uF  [C1206]
C45  100nF  [C1206]
C46  10uF  [C1206]
C47  10uF  [C1206]
C48  100nF  [C1206]
C49  10uF  [C1206]
C50  10uF  [C1206]
D4  1N4148WS  [SOD-323_L1.8-W1.3-LS2.5-RD]
D5  1N4148WS  [SOD-323_L1.8-W1.3-LS2.5-RD]
D6  1N4148WS  [SOD-323_L1.8-W1.3-LS2.5-RD]
D7  1N4148WS  [SOD-323_L1.8-W1.3-LS2.5-RD]
D8  1N4148WS  [SOD-323_L1.8-W1.3-LS2.5-RD]
D9  1N4148WS  [SOD-323_L1.8-W1.3-LS2.5-RD]
Q4  ne006ng  [DFN5X6-8_L5.8-W5.0-P1.27-LS6.2-BL-EP]  (value not drawn)
Q5  ne006ng  [DFN5X6-8_L5.8-W5.0-P1.27-LS6.2-BL-EP]  (value not drawn)
Q6  ne006ng  [DFN5X6-8_L5.8-W5.0-P1.27-LS6.2-BL-EP]  (value not drawn)
Q7  ne006ng  [DFN5X6-8_L5.8-W5.0-P1.27-LS6.2-BL-EP]  (value not drawn)
Q8  ne006ng  [DFN5X6-8_L5.8-W5.0-P1.27-LS6.2-BL-EP]  (value not drawn)
Q9  ne006ng  [DFN5X6-8_L5.8-W5.0-P1.27-LS6.2-BL-EP]  (value not drawn)
R29  10R  [R0603]
R30  10R  [R0603]
R31  10R  [R0603]
R32  10R  [R0603]
R33  10R  [R0603]
R34  10R  [R0603]
R35  20K  [R0603]
R36  20K  [R0603]
R37  20K  [R0603]
R38  20K  [R0603]
R39  20K  [R0603]
R40  20K  [R0603]
R41  5mΩ  [R0612]
R42  5mΩ  [R0612]
R43  5mΩ  [R0612]
U6  SS310肖特基二极管SMA  [SMA_L4.3-W2.6-LS5.1-R-RD]
U7  SS310肖特基二极管SMA  [SMA_L4.3-W2.6-LS5.1-R-RD]
U8  SS310肖特基二极管SMA  [SMA_L4.3-W2.6-LS5.1-R-RD]
U9  IR2101STRPBF  [SOIC-8_L5.0-W4.0-P1.27-LS6.0-BL]
U10  IR2101STRPBF  [SOIC-8_L5.0-W4.0-P1.27-LS6.0-BL]
U11  IR2101STRPBF  [SOIC-8_L5.0-W4.0-P1.27-LS6.0-BL]
U12  EST026  [CONN-TH_L6.3-W0.8-EST026]
U13  EST026  [CONN-TH_L6.3-W0.8-EST026]
U14  EST026  [CONN-TH_L6.3-W0.8-EST026]

### Ports
GHA (in), GHA (out), GHB (in), GHB (out), GHC (in), GHC (out), GLA (in), GLA (out), GLB (in), GLB (out), GLC (in), GLC (out), SHA (in), SHA (out), SHB (in), SHB (out), SHC (in), SHC (out)

### Nets
PGND: C35.1 C36.1 C37.1 C38.1 C39.1 C40.1 C42.1 C43.1 C44.1 C45.1 C46.1 C47.1 C48.1 C49.1 C50.1 R43.1 U9.4(COM) U10.4(COM) U11.4(COM)  [project net AGND]
VBUS: C35.2 C36.2 C37.2 C38.2 C39.2 C40.2 C42.2 C43.2 C44.2 C45.2 C46.2 C47.2 C48.2 C49.2 C50.2 Q4.5(D) Q4.6(D) Q4.7(D) Q4.8(D) Q5.5(D) Q5.6(D) Q5.7(D) Q5.8(D) Q6.5(D) Q6.6(D) Q6.7(D) Q6.8(D) U6.1(A) U7.1(A) U8.1(A) U9.1(VCC) U10.1(VCC) U11.1(VCC)
GNDSL: Q9.1(S) Q9.2(S) Q9.3(S) R40.1 R41.1 R42.1 R43.2
GNDSLA: Q7.1(S) Q7.2(S) Q7.3(S) R38.1 R41.2
GNDSLB: Q8.1(S) Q8.2(S) Q8.3(S) R39.1 R42.2
U: C33.1 C34.1 Q4.1(S) Q4.2(S) Q4.3(S) Q7.5(D) Q7.6(D) Q7.7(D) Q7.8(D) R35.1 U11.6(VS) U14.1 U14.2 ; port SHA
UN: U11.3(LIN)
UP: U11.2(HIN)
V: C29.1 C30.1 Q5.1(S) Q5.2(S) Q5.3(S) Q8.5(D) Q8.6(D) Q8.7(D) Q8.8(D) R36.1 U9.6(VS) U13.1 U13.2 ; port SHB
VN: U9.3(LIN)
VP: U9.2(HIN)
W: C31.1 C32.1 Q6.1(S) Q6.2(S) Q6.3(S) Q9.5(D) Q9.6(D) Q9.7(D) Q9.8(D) R37.1 U10.6(VS) U12.1 U12.2 ; port SHC
WN: U10.3(LIN)
WP: U10.2(HIN)
NetC29_2: C29.2 C30.2 U6.2(K) U9.8(VB)
NetC31_2: C31.2 C32.2 U7.2(K) U10.8(VB)
NetC33_2: C33.2 C34.2 U8.2(K) U11.8(VB)
NetD4_1: D4.1(K) R29.2 U9.7(HO)
NetD4_2: D4.2(A) Q5.4(G) R29.1 R36.2 ; port GHB
NetD5_1: D5.1(K) R30.2 U10.7(HO)
NetD5_2: D5.2(A) Q6.4(G) R30.1 R37.2 ; port GHC
NetD6_1: D6.1(K) R31.2 U11.7(HO)
NetD6_2: D6.2(A) Q4.4(G) R31.1 R35.2 ; port GHA
NetD7_1: D7.1(K) R32.2 U9.5(LO)
NetD7_2: D7.2(A) Q8.4(G) R32.1 R39.2 ; port GLB
NetD8_1: D8.1(K) R33.2 U10.5(LO)
NetD8_2: D8.2(A) Q9.4(G) R33.1 R40.2 ; port GLC
NetD9_1: D9.1(K) R34.2 U11.5(LO)
NetD9_2: D9.2(A) Q7.4(G) R34.1 R38.2 ; port GLA

### Notes on the sheet
- Labels drawn without touching a wire or pin: VSB_OUT

### Library data of the parts
C29-C40 = CAP_0603: as C1 on sheet POWER; Device: CAP_0603; Supplier Footprint: 0603; AddInBom: yes; FootprintName: C0603
  C29 C31 C33 C36 C38 C40: Value: 0.1 μF
  C30 C32 C34: Value: 1 μF
  C35 C37 C39: Value: 10 μF
C42 C45 C48 = CL31B104KBCNNNC: 容值:100nF;精度:±10%;额定电压:50V;温度系数:X7R;; Manufacturer: SAMSUNG(三星); AddInBom: yes; ModelId: e4be705b945545a48e666415e3682bd8聨0819f05c4eef4c71ace90d822a990e87; ModelName: C1206_L3.2-W1.6-H1.3; ModelTransform: 125.984,62.992,0,0,0,0,0,0,0; Tolerance: ±10%; Voltage Rating: 50V; Temperature Coefficient: X7R; Symbol: CL31B104KBCNNNC; Device: CL31B104KBCNNNC; LCSC Part Name: 100nF ±10% 50V; SupplierPart: C24497; ManufacturerPart: CL31B104KBCNNNC; Supplier Footprint: 1206; JLCPCB Part Class: Basic Part; Datasheet: https://item.szlcsc.com/datasheet/CL31B104KBCNNNC/25237.html; Supplier: LCSC; ConvertToPcb: yes; FootprintName: C1206; Value: 100nF
C43 C44 C46 C47 C49 C50 = HGC1206R5106M500NSPJ: 容值:10uF;精度:±20%;额定电压:50V;温度系数:X5R;; Manufacturer: Chinocera(华瓷); AddInBom: yes; ModelId: e4be705b945545a48e666415e3682bd8聨0819f05c4eef4c71ace90d822a990e87; ModelName: C1206_L3.2-W1.6-H1.3; ModelTransform: 125.984,62.992,0,0,0,0,0,0,0; Tolerance: ±20%; Voltage Rating: 50V; Temperature Coefficient: X5R; Symbol: HGC1206R5106M500NSPJ; Device: HGC1206R5106M500NSPJ; LCSC Part Name: 10uF ±20% 50V; SupplierPart: C7432782; ManufacturerPart: HGC1206R5106M500NSPJ; Supplier Footprint: 1206; JLCPCB Part Class: Extended Part; Datasheet: https://item.szlcsc.com/datasheet/HGC1206R5106M500NSPJ/8438264.html; Supplier: LCSC; ConvertToPcb: yes; FootprintName: C1206; Value: 10uF
D4-D9 = 1N4148WS_C2128: 二极管配置:独立式;整流电流:150mA;直流反向耐压(Vr):100V;正向压降(Vf):1.25V@150mA;反向恢复时间(Trr):4ns;; Manufacturer: CJ(江苏长电/长晶); Symbol: 1N4148WS T4; 3D Model: db63db13d9e342eb939127d413d6200b聨0819f05c4eef4c71ace90d822a990e87; 3D Model Transform: 104.3305,51.181,0,0,0,0,0,-0.004,0; Diode Configuration: 独立式; Pd - Power Dissipation: 200mW; Current - Rectified: 150mA; Voltage - DC Reverse(Vr): 100V; Non-Repetitive Peak Forward Surge Current: 2A; Reverse Leakage Current (Ir): 1uA@75V; Reverse Recovery Time (trr): 4ns; AddInBom: yes; Device: 1N4148WS_C2128; LCSC Part Name: 丝印T4 100V 150mA; Supplier Part: C2128; Manufacturer Part: 1N4148WS; Supplier Footprint: SOD-323; JLCPCB Part Class: Basic Part; Datasheet: https://item.szlcsc.com/datasheet/1N4148WS/2485.html; Supplier: LCSC; Voltage - Forward(Vf@If): 1.25V@150mA; Operating Junction Temperature Range: -; ConvertToPcb: yes; FootprintName: SOD-323_L1.8-W1.3-LS2.5-RD; ModelName: SOD-323_L1.8-W1.3-LS2.5-RD
Q4-Q9 = ne006ng: 数量:1个N沟道;漏源电压(Vdss):60V;连续漏极电流(Id):70A;导通电阻(RDS(on)):4.6mΩ@10V;耗散功率(Pd):84W;阈值电压(Vgs(th)):2.7V;; Manufacturer: DOINGTER(杜因特); AddInBom: yes; ModelId: 82d86f10988147ef9b82700d9bd42f65; ModelTransform: 200.787,239.17275,0,0,0,0,0.002,-0.004,0; Number: 1个N沟道; Drain to Source Voltage: 60V; Current - Continuous Drain(Id): 70A; Pd - Power Dissipation: 84W; Gate Threshold Voltage (Vgs(th)): 2.7V; Gate Charge(Qg): 90nC@10V; Input Capacitance(Ciss): 4nF; Reverse Transfer Capacitance (Crss@Vds): 252pF; Type: N沟道; Output Capacitance(Coss): 309pF; LCSC Part Name: N沟道MOSFET采用先进沟槽技术，具备低栅极电荷和出色散热性能; SupplierPart: C54157801; ManufacturerPart: NE006NG; Supplier Footprint: DFN-8(5x6); JLCPCB Part Class: Extended Part; Datasheet: https://item.szlcsc.com/datasheet/NE006NG/57396370.html; Supplier: LCSC; ConvertToPcb: yes; SymbolName: NE006NG; FootprintName: DFN5X6-8_L5.8-W5.0-P1.27-LS6.2-BL-EP; ModelName: DFN5X6-8_L5.8-W5.0-P1.27-LS6.2-BL-EP; RDS(on): 4.6mΩ@10V; Operating Temperature: -50℃~+150℃
R29-R40 = Res_0603: as R1 on sheet POWER; Device: Res_0603; Supplier Footprint: 0603; AddInBom: yes; FootprintName: R0603; ModelName: R0603
  R29-R34: Value: 10R
  R35-R40: Value: 20K
R41-R43 = MLR06A1R005F2: 电阻类型:合金电阻;阻值:5mΩ;精度:±1%;功率:1W;温度系数:±50ppm/℃;安装方式:贴片;; Manufacturer: prosemi(普罗森美); AddInBom: yes; ModelId: f1de2025d8034c8f979ea2bb0fb44f5c聨0819f05c4eef4c71ace90d822a990e87; ModelTransform: 62.992,125.984,0,0,0,0,0,0,0; Tolerance: ±1%; Power(Watts): 1W; Symbol: MLR06A1R005F2; Device: MLR06A1R005F2; LCSC Part Name: 5mΩ ±1% 1W; SupplierPart: C21261109; ManufacturerPart: MLR06A1R005F2; Supplier Footprint: 0612; JLCPCB Part Class: Extended Part; Datasheet: https://item.szlcsc.com/datasheet/MLR06A1R005F2/22679766.html; Supplier: LCSC; ConvertToPcb: yes; FootprintName: R0612; ModelName: R0612; Type: 合金电阻; Value: 5mΩ; Temperature Coefficient: ±50ppm/℃; Mounting Type: 贴片
U6-U8 = SS310肖特基二极管SMA: 3D Model: 6890bb9641474820a71fce2135ca3aaa聨0819f05c4eef4c71ace90d822a990e87; 3D Model Transform: 194.8815,98.425,0,0,0,0,0,0,0; AddInBom: yes; Symbol: SS310肖特基二极管SMA; Device: SS310肖特基二极管SMA; LCSC Part Name: SS310肖特基二极管SMA; Supplier Part: C9900014981; Manufacturer Part: SS310肖特基二极管SMA; Supplier Footprint: SS310SMA110V; JLCPCB Part Class: Extended Part; Supplier: LCSC; ConvertToPcb: yes; FootprintName: SMA_L4.3-W2.6-LS5.1-R-RD; ModelName: SMA_L4.3-W2.6-LS5.1-R-RD
U9-U11 = IR2101STRPBF: 驱动配置:半桥;负载类型:IGBT；MOSFET;驱动通道数:2;灌电流(IOL):270mA;拉电流(IOH):130mA;工作电压:10V~20V;上升时间(tr):100ns;下降时间(tf):50ns;; Manufacturer: Infineon(英飞凌); 3D Model: 7abc64c95a1a4a04a4ef38f9097c870b聨0819f05c4eef4c71ace90d822a990e87; 3D Model Transform: 192.913,236.22,0,0,0,0,0,0,0; Driven Configuration: 半桥; Number of Drivers: 2; Current - Output Low(IOL): 270mA; Current - Output High(IOH): 130mA; Rise Time: 100ns; Fall Time: 50ns; Propagation Delay tpLH: 160ns; Propagation Delay tpHL: 150ns; Quiescent Current(Iq): 150uA; AddInBom: yes; Symbol: IR2101STRPBF; Device: IR2101STRPBF; LCSC Part Name: 高低侧驱动器; Supplier Part: C2956; Manufacturer Part: IR2101STRPBF; Supplier Footprint: SOIC-8; JLCPCB Part Class: Extended Part; Datasheet: https://item.szlcsc.com/datasheet/IR2101STRPBF/3338.html; Supplier: LCSC; Load Type: IGBT；MOSFET; Voltage - Supply: 10V~20V; Features: 交错导通保护; Operating Temperature: -40℃~+150℃; Input Logic Level - High: -; Input Logic Level - Low: -; ConvertToPcb: yes; FootprintName: SOIC-8_L5.0-W4.0-P1.27-LS6.0-BL; ModelName: SOIC-8_L5.0-W4.0-P1.27-LS6.0-BL
U12-U14 = EST026: as U1 on sheet POWER; Symbol: EST026; Device: EST026; LCSC Part Name: EST026; SupplierPart: C52878; ManufacturerPart: EST026; Supplier Footprint: 插件; JLCPCB Part Class: 扩展库; Datasheet: https://item.szlcsc.com/datasheet/EST026/53893.html; Supplier: LCSC; ConvertToPcb: yes; FootprintName: CONN-TH_L6.3-W0.8-EST026; ModelName: CONN-TH_L6.3-W0.8-EST026

## Sheet OPA.SchDoc
size 330 x 114 mm
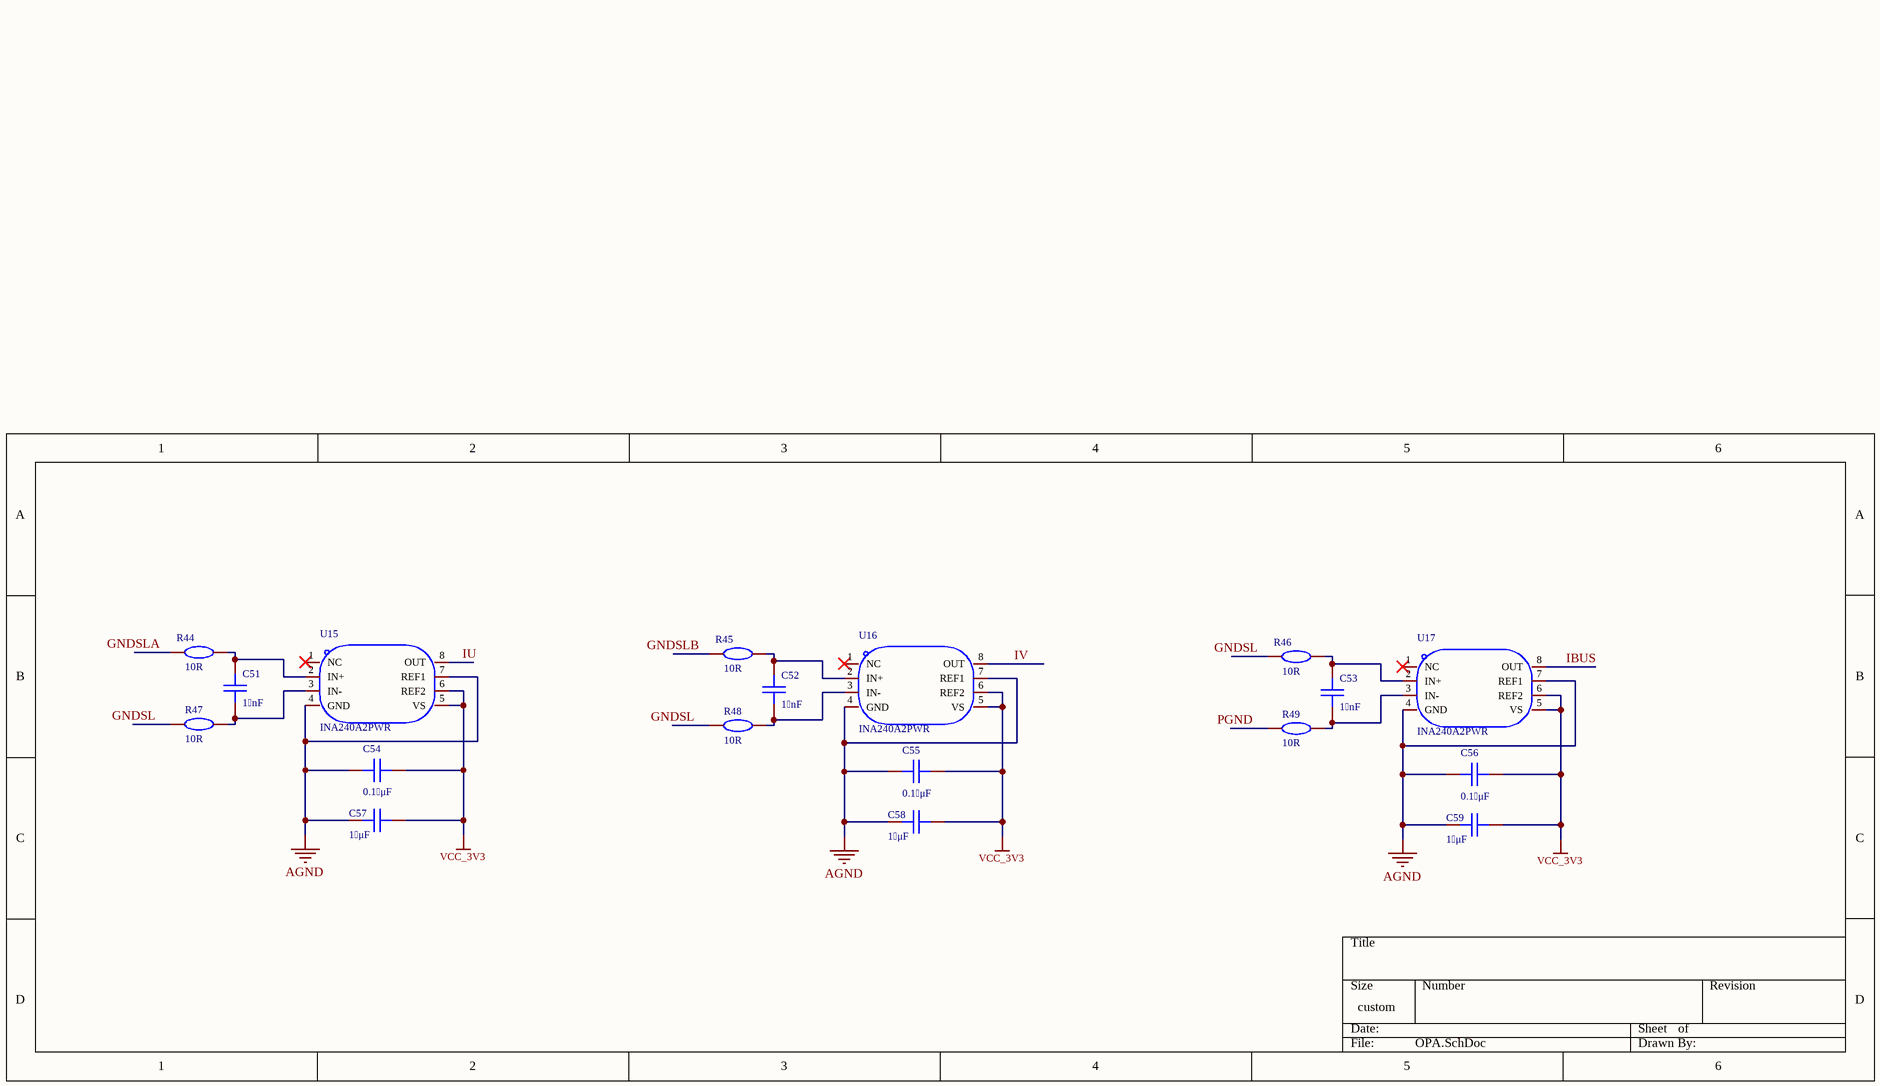
[diagram p3: OPA.SchDoc]

### Parts
C51  1 nF  [C0603]
C52  1 nF  [C0603]
C53  1 nF  [C0603]
C54  0.1 μF  [C0603]
C55  0.1 μF  [C0603]
C56  0.1 μF  [C0603]
C57  1 μF  [C0603]
C58  1 μF  [C0603]
C59  1 μF  [C0603]
R44  10R  [R0603]
R45  10R  [R0603]
R46  10R  [R0603]
R47  10R  [R0603]
R48  10R  [R0603]
R49  10R  [R0603]
U15  INA240A2PWR  [TSSOP-8_L4.4-W3.0-P0.65-LS6.4-BL]
U16  INA240A2PWR  [TSSOP-8_L4.4-W3.0-P0.65-LS6.4-BL]
U17  INA240A2PWR  [TSSOP-8_L4.4-W3.0-P0.65-LS6.4-BL]

### Nets
AGND: C54.2 C55.2 C56.2 C57.2 C58.2 C59.2 R49.2 U15.4(GND) U15.7(REF1) U16.4(GND) U16.7(REF1) U17.4(GND) U17.7(REF1)  [also labelled PGND]
VCC_3V3: C54.1 C55.1 C56.1 C57.1 C58.1 C59.1 U15.5(VS) U15.6(REF2) U16.5(VS) U16.6(REF2) U17.5(VS) U17.6(REF2)
GNDSL: R46.2 R47.2 R48.2
GNDSLA: R44.2
GNDSLB: R45.2
IBUS: U17.8(OUT)
IU: U15.8(OUT)
IV: U16.8(OUT)
NetC51_1: C51.1 R47.1 U15.3(IN-)
NetC51_2: C51.2 R44.1 U15.2(IN+)
NetC52_1: C52.1 R48.1 U16.3(IN-)
NetC52_2: C52.2 R45.1 U16.2(IN+)
NetC53_1: C53.1 R49.1 U17.3(IN-)
NetC53_2: C53.2 R46.1 U17.2(IN+)

Not connected (* = marked no-connect by the designer): U15 1(NC)*; U16 1(NC)*; U17 1(NC)*

### Library data of the parts
C51-C59 = CAP_0603: as C1 on sheet POWER; Device: CAP_0603; Supplier Footprint: 0603; AddInBom: yes; FootprintName: C0603
  C51-C53: Value: 1 nF
  C54-C56: Value: 0.1 μF
  C57-C59: Value: 1 μF
R44-R49 = Res_0603: as R1 on sheet POWER; Device: Res_0603; Supplier Footprint: 0603; Value: 10R; AddInBom: yes; FootprintName: R0603; ModelName: R0603
U15-U17 = INA240A2PWR: 放大器数:单路;共模电压:-4V~80V;增益:50V/V;带宽:400kHz;; Manufacturer: TI(德州仪器); 3D Model: 85577802f9634e7e85ffa2fd25a37b6f聨0819f05c4eef4c71ace90d822a990e87; 3D Model Transform: 118.11,251.968,0,0,0,0,0,0,0; Number of Channels: 单路; Gain: 50V/V; Bandwidth: 400kHz; Ib - Input Bias Current: 90uA; Vos - Input Offset Voltage: 5uV; Differential Voltage: -80V~+80V; Single Supply: 2.7V~5.5V; Quiescent Current: 1.8mA; Input Offset Voltage Drift(Vos TC): 250nV/℃; Slew Rate: 2V/us; Common Mode Rejection Ratio (CMRR): 132dB; Noise density(eN): 40nV/√Hz@1kHz; AddInBom: yes; ModelName: TSSOP-8_L4.4-W3.0-P0.65-LS6.4-BL-2; Symbol: INA240A2PWR; Device: INA240A2PWR; LCSC Part Name: 具有增强型PWM抑制功能的高侧和低侧双向零漂移电流感测放大器; Supplier Part: C129949; Manufacturer Part: INA240A2PWR; Supplier Footprint: TSSOP-8; JLCPCB Part Class: Extended Part; Datasheet: https://www.ti.com/cn/lit/gpn/ina240; Supplier: LCSC; Vcm - Common Mode Voltage: -4V~80V; Operating Temperature: -40℃~+125℃; Maximum Power Supply Range (Vdd-Vss): -; Dual Supply: -; Output Current: -; Input Offset Current(Ios): -; Input Offset Current Drift (Ios TC): -; ConvertToPcb: yes; FootprintName: TSSOP-8_L4.4-W3.0-P0.65-LS6.4-BL

## Nets that join several sheets
AGND: POWER (22 pins), MCU (41 pins), PreDriver (19 pins), OPA (13 pins)
VBUS: POWER (C41.1 Q1.2 R12.2), PreDriver (33 pins)
VCC_3V3: POWER (C7.1 D10.1 R7.2 U4.5), MCU (24 pins), OPA (12 pins)
VCC_5V: POWER (8 pins), MCU (C25.1 P1.1 R27.2)
GNDSL: PreDriver (7 pins), OPA (R46.2 R47.2 R48.2)
GNDSLA: PreDriver (5 pins), OPA (R44.2)
GNDSLB: PreDriver (5 pins), OPA (R45.2)
IBUS: MCU (U5.16), OPA (U17.8)
IU: MCU (U5.8), OPA (U15.8)
IV: MCU (U5.9), OPA (U16.8)
UN: MCU (U5.27), PreDriver (U11.3)
UP: MCU (U5.30), PreDriver (U11.2)
VBUS/11: POWER (C12.2 D10.2 R13.1), MCU (U5.17)
VBUS_EN: POWER (R6.1), MCU (U5.25)
VN: MCU (U5.28), PreDriver (U9.3)
VP: MCU (U5.31), PreDriver (U9.2)
WN: MCU (U5.29), PreDriver (U10.3)
WP: MCU (U5.32), PreDriver (U10.2)